# Altium schematic sheet MPU-PIO.SchDoc
size A4; SheetNumber: 3; SheetTotal: 7
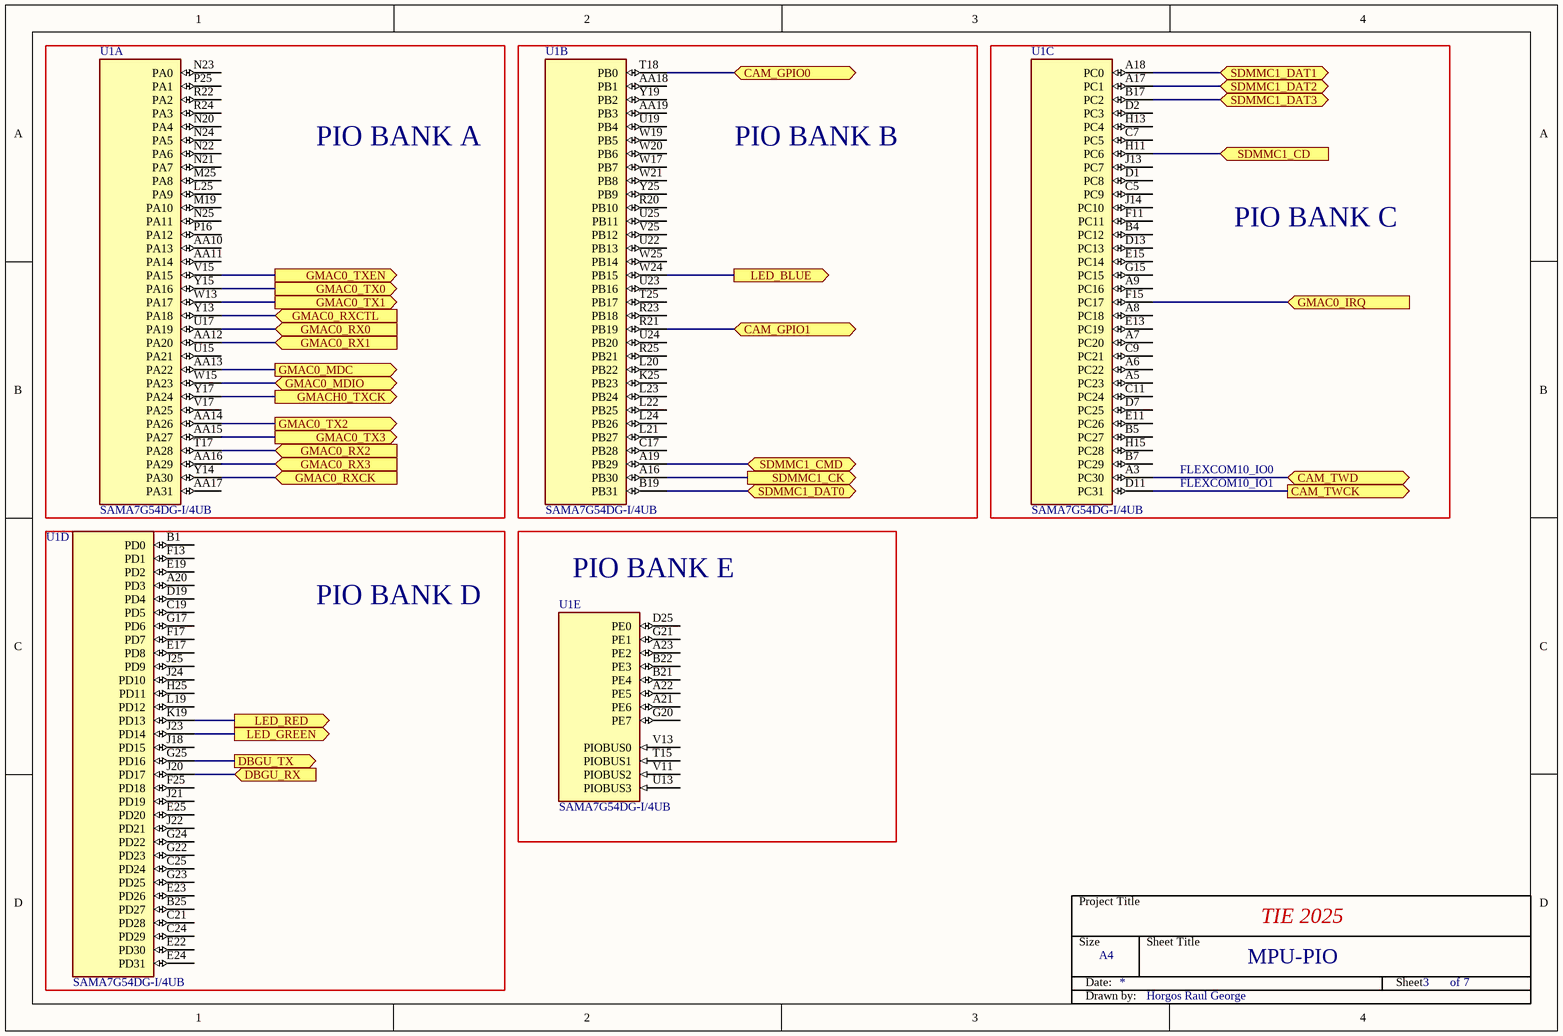
[diagram p0: MPU-PIO.SchDoc]

## Parts
Title_3  Title Block  (value not drawn)  (graphical)
U1  SAMA7G54DG-I/4UB  [BGA427C80P25X21_2100X1800X120]  (parts A,B,C,D,E of 8)

## Blocks framed on the sheet
PIO BANK A: U1
PIO BANK B: U1
PIO BANK C: U1
PIO BANK D: U1
PIO BANK E: U1

## Ports
CAM_GPIO0 (bidir, see SDCard-MIPI-User[1B]), CAM_GPIO1 (bidir, see SDCard-MIPI-User[1B]), CAM_TWCK (out, see SDCard-MIPI-User[1B]), CAM_TWD (bidir, see SDCard-MIPI-User[1B]), DBGU_RX (in, see SDCard-MIPI-User[2D]), DBGU_TX (out, see SDCard-MIPI-User[2D]), GMAC0_IRQ (in, see Ethernet[1C]), GMAC0_MDC (out, see Ethernet[1C]), GMAC0_MDIO (bidir, see Ethernet[1C]), GMAC0_RX0 (in, see Ethernet[1C]), GMAC0_RX1 (in, see Ethernet[1C]), GMAC0_RX2 (in, see Ethernet[1C]), GMAC0_RX3 (in, see Ethernet[1C]), GMAC0_RXCK (in, see Ethernet[1C]), GMAC0_RXCTL (in, see Ethernet[1C]), GMAC0_TX0 (out, see Ethernet[1C]), GMAC0_TX1 (out, see Ethernet[1C]), GMAC0_TX2 (out, see Ethernet[1C]), GMAC0_TX3 (out, see Ethernet[1C]), GMAC0_TXEN (out, see Ethernet[1C]), GMACH0_TXCK (out, see Ethernet[1C]), LED_BLUE (out, see SDCard-MIPI-User[1C]), LED_GREEN (out, see SDCard-MIPI-User[1C]), LED_RED (out, see SDCard-MIPI-User[1C]), SDMMC1_CD (in, see SDCard-MIPI-User[2B]), SDMMC1_CK (out, see SDCard-MIPI-User[2B]), SDMMC1_CMD (bidir, see SDCard-MIPI-User[2B]), SDMMC1_DAT0 (bidir, see SDCard-MIPI-User[2A]), SDMMC1_DAT1 (bidir, see SDCard-MIPI-User[2A]), SDMMC1_DAT2 (bidir, see SDCard-MIPI-User[2A]), SDMMC1_DAT3 (bidir, see SDCard-MIPI-User[2A])

## Nets
CAM_GPIO0: U1.T18(PB0) ; port CAM_GPIO0
CAM_GPIO1: U1.R21(PB19) ; port CAM_GPIO1
CAM_TWCK: U1.D11(PC31) ; port CAM_TWCK
CAM_TWD: U1.A3(PC30) ; port CAM_TWD
DBGU_RX: U1.J20(PD17) ; port DBGU_RX
DBGU_TX: U1.G25(PD16) ; port DBGU_TX
GMAC0_IRQ: U1.F15(PC17) ; port GMAC0_IRQ
GMAC0_MDC: U1.AA13(PA22) ; port GMAC0_MDC
GMAC0_MDIO: U1.W15(PA23) ; port GMAC0_MDIO
GMAC0_RX0: U1.U17(PA19) ; port GMAC0_RX0
GMAC0_RX1: U1.AA12(PA20) ; port GMAC0_RX1
GMAC0_RX2: U1.T17(PA28) ; port GMAC0_RX2
GMAC0_RX3: U1.AA16(PA29) ; port GMAC0_RX3
GMAC0_RXCK: U1.Y14(PA30) ; port GMAC0_RXCK
GMAC0_RXCTL: U1.Y13(PA18) ; port GMAC0_RXCTL
GMAC0_TX0: U1.Y15(PA16) ; port GMAC0_TX0
GMAC0_TX1: U1.W13(PA17) ; port GMAC0_TX1
GMAC0_TX2: U1.AA14(PA26) ; port GMAC0_TX2
GMAC0_TX3: U1.AA15(PA27) ; port GMAC0_TX3
GMAC0_TXEN: U1.V15(PA15) ; port GMAC0_TXEN
GMACH0_TXCK: U1.Y17(PA24) ; port GMACH0_TXCK
LED_BLUE: U1.W24(PB15) ; port LED_BLUE
LED_GREEN: U1.J23(PD14) ; port LED_GREEN
LED_RED: U1.K19(PD13) ; port LED_RED
SDMMC1_CD: U1.H11(PC6) ; port SDMMC1_CD
SDMMC1_CK: U1.A16(PB30) ; port SDMMC1_CK
SDMMC1_CMD: U1.A19(PB29) ; port SDMMC1_CMD
SDMMC1_DAT0: U1.B19(PB31) ; port SDMMC1_DAT0
SDMMC1_DAT1: U1.A18(PC0) ; port SDMMC1_DAT1
SDMMC1_DAT2: U1.A17(PC1) ; port SDMMC1_DAT2
SDMMC1_DAT3: U1.B17(PC2) ; port SDMMC1_DAT3

Not connected (* = marked no-connect by the designer): U1 A5(PC23) A6(PC22) A7(PC20) A8(PC18) A9(PC16) A20(PD3) A21(PE6) A22(PE5) A23(PE2) AA10(PA13) AA11(PA14) AA17(PA31) AA18(PB1) AA19(PB3) B1(PD0) B4(PC12) B5(PC27) B7(PC29) B21(PE4) B22(PE3) B25(PD27) C5(PC9) C7(PC5) C9(PC21) C11(PC24) C17(PB28) C19(PD5) C21(PD28) C24(PD29) C25(PD24) D1(PC8) D2(PC3) D7(PC25) D13(PC13) D19(PD4) D25(PE0) E11(PC26) E13(PC19) E15(PC14) E17(PD8) E19(PD2) E22(PD30) E23(PD26) E24(PD31) E25(PD20) F11(PC11) F13(PD1) F17(PD7) F25(PD18) G15(PC15) G17(PD6) G20(PE7) G21(PE1) G22(PD23) G23(PD25) G24(PD22) H13(PC4) H15(PC28) H25(PD11) J13(PC7) J14(PC10) J18(PD15) J21(PD19) J22(PD21) J24(PD10) J25(PD9) K25(PB23) L19(PD12) L20(PB22) L21(PB27) L22(PB25) L23(PB24) L24(PB26) L25(PA9) M19(PA10) M25(PA8) N20(PA4) N21(PA7) N22(PA6) N23(PA0) N24(PA5) N25(PA11) P16(PA12) P25(PA1) R20(PB10) R22(PA2) R23(PB18) R24(PA3) R25(PB21) T15(PIOBUS1) T25(PB17) U13(PIOBUS3) U15(PA21) U19(PB4) U22(PB13) U23(PB16) U24(PB20) U25(PB11) V11(PIOBUS2) V13(PIOBUS0) V17(PA25) V25(PB12) W17(PB7) W19(PB5) W20(PB6) W21(PB8) W25(PB14) Y19(PB2) Y25(PB9)

## Notes on the sheet
- FLEXCOM10_IO0
- FLEXCOM10_IO1
- MPU-PIO
- (in symbol Title Block) Project Title; TIE 2025; Size; Sheet Title; A4; Date:; Sheet; of; Drawn by:; Horgos Raul George

## Library data of the parts
U1 = SAMA7G54DG-I/4UB: MCHP MPU SiP 32-BIT Cortex-A7 1000MHz 128kB 2Gbit / SAMA7G54D2G-I/4UB LFBGA-427; Manufacturer: Microchip Technology; Manufacturer Part Number: SAMA7G54DG-I/4UB